# Altium schematic sheet Power.SchDoc
size A
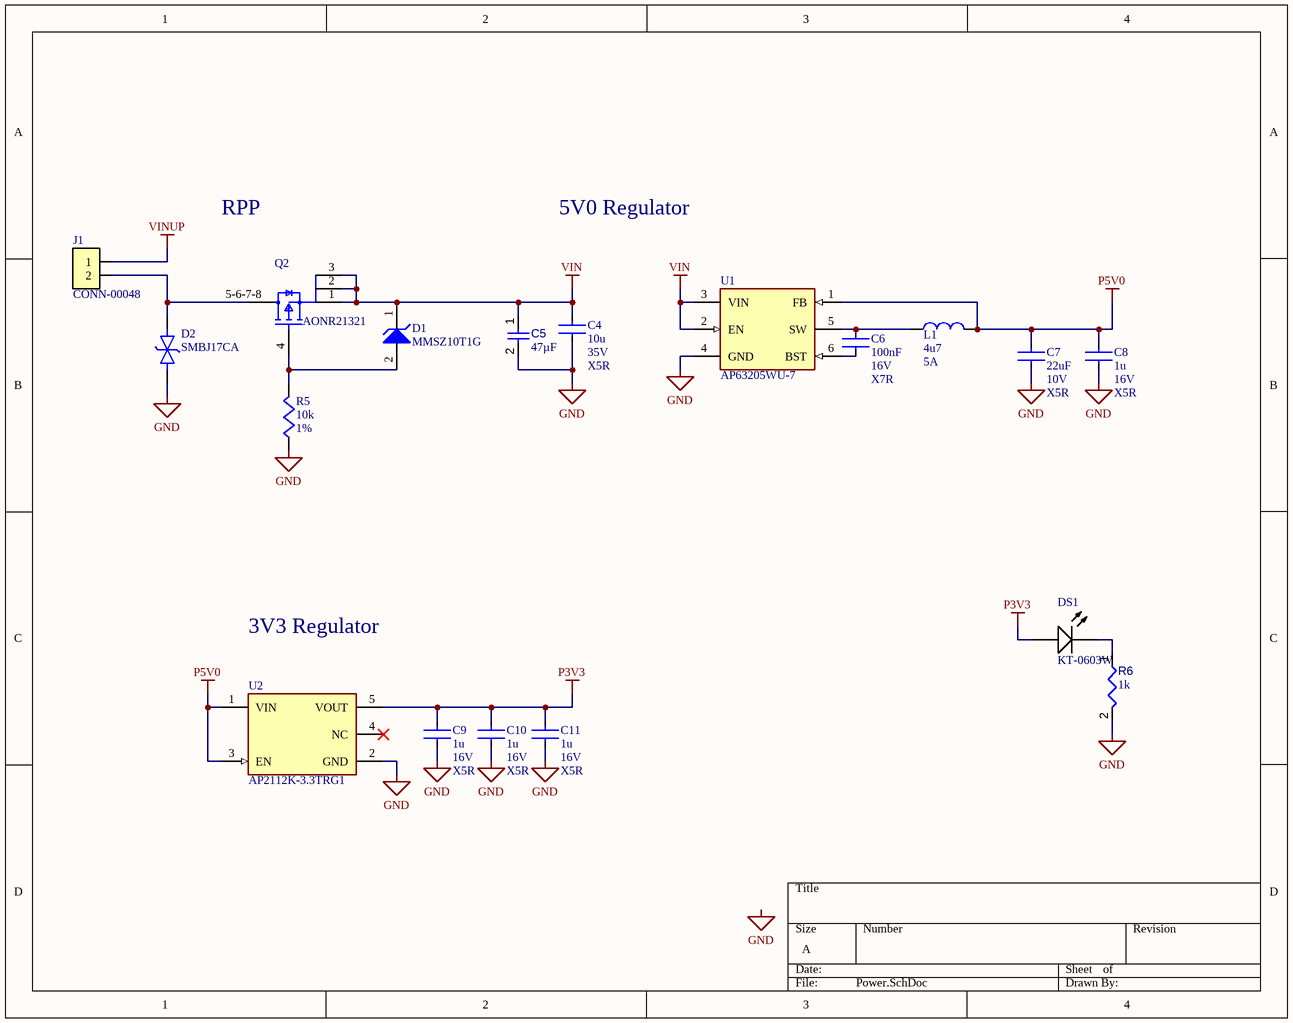
[diagram p0: Power.SchDoc]

## Parts
C4  value 10u  Voltage: 35V  Dielectric: X5R  [C0603]  (hidden comment: 10uF 35V 0603)
C5  value 47µF  [CAPC0805(2012)145_L]  (hidden comment: Capacitor 47µF +/-40% 6.3V 0805)
C6  value 100nF  Voltage: 16V  Dielectric: X7R  [C0402]  (hidden comment: 100n 16V X7R 0402)
C7  value 22uF  Voltage: 10V  Dielectric: X5R  [C0603]  (hidden comment: 22uF 10V 0603 X5R)
C8  value 1u  Voltage: 16V  Dielectric: X5R  [C0402]  (hidden comment: 1uF 16V X5R 0402)
C9  value 1u  Voltage: 16V  Dielectric: X5R  [C0402]  (hidden comment: 1uF 16V X5R 0402)
C10  value 1u  Voltage: 16V  Dielectric: X5R  [C0402]  (hidden comment: 1uF 16V X5R 0402)
C11  value 1u  Voltage: 16V  Dielectric: X5R  [C0402]  (hidden comment: 1uF 16V X5R 0402)
D1  MMSZ10T1G  [ONSC-SOD-123-2-425-04_V]
D2  SMBJ17CA  [DO214-AA]
DS1  KT-0603W  [LED0603]
J1  CONN-00048  [JST_PHR_2_0]
L1  value 4u7  Saturation Current: 5A  [INDP5452X30N]  (hidden comment: 4.7uH 4.5A FXL0530-4R7-M)
Q2  AONR21321  [FP-DFN3x3A_8L_EP1_P-MFG]
R5  value 10k  Tolerance: 1%  [R0402]  (hidden comment: 10k 1% 0402)
R6  value 1k  [RESC0805(2012)_L]  (hidden comment: Resistor 1K +/-5% 0805 125 mW)
U1  AP63205WU-7  [FP-TSOT26-IPC_B]
U2  AP2112K-3.3TRG1  [FP-SOT25-IPC_A]

## Nets
GND: C4.2 C5.2 C7.2 C8.2 C9.2 C10.2 C11.2 D2.1 R5.1 R6.2 U1.4(GND) U2.2(GND)
P3V3: C9.1 C10.1 C11.1 DS1.2(A) U2.5(VOUT)
P5V0: C7.1 C8.1 L1.2 U1.1(FB) U2.1(VIN) U2.3(EN)
VIN: C4.1 C5.1 D1.1(K) Q2.1(S) Q2.2(S) Q2.3(S) U1.2(EN) U1.3(VIN)
VINUP: J1.1
NetC6_1: C6.1 L1.1 U1.5(SW)
NetC6_2: C6.2 U1.6(BST)
NetD1_2: D1.2(A) Q2.4(G) R5.2
NetD2_2: D2.2 J1.2 Q2.5-6-7-8(D)
NetDS1_1: DS1.1(K) R6.1

Not connected (* = marked no-connect by the designer): U2 4(NC)*

## Notes on the sheet
- RPP
- 5V0 Regulator
- 3V3 Regulator
- Labels drawn without touching a wire or pin: GND

## Library data of the parts
C4 = CMP-001-00102-3: 35V 10uF X5R ±20% 0603 Multilayer Ceramic Capacitors MLCC - SMD/SMT ROHS; Package: 0603; LCSC Part #: C194427
C5 = CMP-001-00082-3: Chip Capacitor, 47µF +/-40%, 6.3V, 0805, Thickness 1.45 mm; Tolerance: 10%; Mounting Technology: SMT; Min Operating Temperature: -55°C; Voltage Rating: 6.3V; Max Operating Temperature: 85°C; Case/Package: 0805; Pins: 2
C6 = CMP-001-00088-6: 100nF 16V X7R ±10% 0402 Multilayer Ceramic Capacitors MLCC - SMD/SMT ROHS; LCSC Part #: C1525; Package: 0402
C7 = CMP-001-00110-2: 10V 22uF X5R ±20% 0603 Multilayer Ceramic Capacitors MLCC - SMD/SMT ROHS; LCSC Part #: C86295; Package: 0603
C8-C11 = CMP-001-00098-3: 16V 1uF X5R ±10% 0402 Multilayer Ceramic Capacitors MLCC - SMD/SMT ROHS; LCSC Part #: C29266; Package: 0402
D1 = CMP-1060-00410-1: Zener Voltage Regulator, 500 mW, 2-Pin SOD-123, Pb-Free, Tape and Reel; Manufacturer: On Semiconductor; P Max (W): 0.5; ComponentLink1URL: http://www.onsemi.com/; RoHS: Pb-Free; ComponentLink3Description: Package Specification; Packing: Tape and Reel; PackageVersion: Rev. G, 10/2009; ComponentLink3URL: http://www.onsemi.com/pub_link/Collateral/425-04.PDF; PartNumber: MMSZ10T1G; ComponentLink2Description: Datasheet; Mounting Technology: Surface Mount; PackageReference: SOD-123-2-425-04; DatasheetVersion: Rev. 11; ComponentLink1Description: Manufacturer URL; ComponentLink2URL: http://www.onsemi.com/pub_link/Collateral/MMSZ2V4T1-D.PDF; PackageDescription: 2-Pin SOD, Body 1.6 x 2.69 mm
D2 = CMP-004-00048-1: Trans Voltage Suppressor Diode, 600W, 17V V(RWM), Bidirectional, 1 Element, Silicon; Max Operating Temperature: 170°C; Min Operating Temperature: -55°C
DS1 = CMP-00026-00001-1: Forward Voltage Min: 2.6; Forward Voltage Max: 3.1; Case/Package: 0603; Pins: 2
J1 = CMP-019-000047-1: JST PH 2x1, THT, 2.00mm Pitch; Manufacturer PN: B2B-PH-K; Positions per level: 2; Levels: 1; Pin Count: 2; Component Type: Standard; Type: Header; Part Number: CONN-00048; Source: Connectors$.SchLib; Design Item ID: CONN-00048; Cost: 0.19; Manufacturer: JST
L1 = CMP-006-00030-1: 4.5A 4.7uH Integrated molded inductor ±20% 5A SMD,5.2x5.4mm Power Inductors ROHS; LCSC Part #: C177246; Footprint: SMD,5.2x5.4mm
Q2 = CMP-83955-000004-1: MOSFET P-CH 30V 3X3 DFN EP; Manufacturer: Alpha & Omega Semiconductor; Power Dissipation: 4.1W; Threshold Vgs Max: -2.3V; Reverse Recovery Time: 10ns; Max Forward Diode Voltage: -1V; Typ Forward Diode Voltage: -0.72V; Threshold Vgs Min: -1.3V; Standoff Height: 0mm; Number Of P Channels: 1; Max Junction Temp: +150°C; Reverse Recovery Charge: 15nC; Transconductance: 25S; Depletion Mode: False; Gate To Source Voltage: 25V; Continuous Drain Current: -24A; Turn On Delay Time: 10.5ns; Rthja Max: 60°C/W; Drain To Source Voltage: -30V; Pulse Drain Current: -66A; Turn Off Delay Time: 30ns; Gate Charge At Vgs: 21nC @ -10V; Drain To Source Resistance: 13.5mΩ; Input Capacitace At Vds: 1180pF @ -15V; Manufacturer Part Number: AONR21321; Temperature: -55°C to +150°C; Package: DFN3x3A_8L_EP1_P; Digikey Description: MOSFET P-CH 30V 3X3 DFN EP; RoHS: TRUE; Lead Free: Yes; Footprint Url: http://www.aosmd.com/res/packaging_information/DFN3x3-8L.pdf; Category: Trans; Temperature Range Low: -55°C; ComponentLink2URL: http://www.aosmd.com/pdfs/datasheet/AONR21321.pdf; Temperature Range High: +150°C; Automotive: No; Device Class L2: Transistors; Height: 0.9mm; Drain To Source Breakdown Voltage: -30V; Device Class L3: MOSFETs; Number Of Channels: 1; Octopart: https://octopart.com/aonr21321-alpha+%26+omega+semiconductor-96014005; Device Class L1: Discrete Semiconductors; ComponentLink2Description: Datasheet
R5 = CMP-009-00187-3: 62.5mW Thick Film Resistors 50V ±100ppm/℃ ±1% 10kΩ 0402 Chip Resistor - Surface Mount ROHS; Package: 0402; LCSC Part #: C60490
R6 = CMP-009-00118-2: Chip Resistor, 1 kOhms, +/-5%, 125 mW, -55 to 155 degC, 0805; Power: 125mW; Tolerance: 5%; Max Operating Temperature: 155°C; Min Operating Temperature: -55°C; Pins: 2; Case/Package: 0805
U1 = CMP-019-00066-4: Switching Regulator
U2 = CMP-12756-000035-1: IC REG LINEAR 3.3V 600MA SOT25; Number of Regulators: 1; Output Type: Fixed; Polarity: Positive; Min Input Voltage: 2.5V; Max Input Voltage: 6V; Accuracy: 1.5%; Quiescent Current: 55uA; Dropout Voltage: 250mV; Min Operating Temperature: -40°C; Length: 3.1mm; Output Current: 600mA; Max Operating Temperature: 85°C; Package Quantity: 1; Output Voltage: 3.3V; Width: 1.7mm; Number of Outputs: 1; Packaging: Tape and Reel; Height: 1.3mm; Lead Free: Lead Free; Max Output Current: 600mA; Case/Package: SOT-23-5; Mount: Surface Mount; Number of Pins: 5